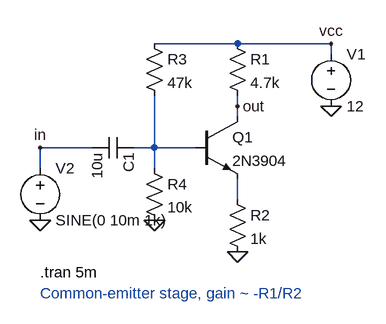
[diagram p0: schematic ce_amplifier.asc]
ce_amplifier.asc, the LTspice schematic file:
Version 4
SHEET 1 880 680
WIRE 240 80 368 80
WIRE 368 80 512 80
WIRE 512 80 512 96
WIRE 368 160 368 192
WIRE 368 288 368 320
WIRE 240 160 240 240
WIRE 240 240 240 272
WIRE 208 240 240 240
WIRE 240 240 304 240
WIRE 64 240 64 272
WIRE 144 240 64 240
FLAG 368 400 0
FLAG 240 352 0
FLAG 512 176 0
FLAG 64 352 0
FLAG 512 80 vcc
FLAG 64 240 in
FLAG 368 176 out
SYMBOL npn 304 192 R0
SYMATTR InstName Q1
SYMATTR Value 2N3904
SYMBOL res 352 64 R0
SYMATTR InstName R1
SYMATTR Value 4.7k
SYMBOL res 352 304 R0
SYMATTR InstName R2
SYMATTR Value 1k
SYMBOL res 224 64 R0
SYMATTR InstName R3
SYMATTR Value 47k
SYMBOL res 224 256 R0
SYMATTR InstName R4
SYMATTR Value 10k
SYMBOL cap 208 224 R90
SYMATTR InstName C1
SYMATTR Value 10u
SYMBOL voltage 512 80 R0
SYMATTR InstName V1
SYMATTR Value 12
SYMBOL voltage 64 256 R0
SYMATTR InstName V2
SYMATTR Value SINE(0 10m 1k)
TEXT 64 432 Left 2 !.tran 5m
TEXT 64 464 Left 2 ;Common-emitter stage, gain ~ -R1/R2

The netlist it stands for:
* ce_amplifier.asc
Q1 out N002 N001 0 2N3904
R1 vcc out 4.7k
R2 N001 0 1k
R3 vcc N002 47k
R4 N002 0 10k
C1 N002 in 10u
V1 vcc 0 12
V2 in 0 SINE(0 10m 1k)
.model NPN NPN
.model PNP PNP
.lib standard.bjt
.tran 5m
* Common-emitter stage, gain ~ -R1/R2
.backanno
.end